# Altium schematic sheet RR-Sheet.SchDoc
size 420 x 297 mm; SheetNumber: 1; SheetTotal: 1
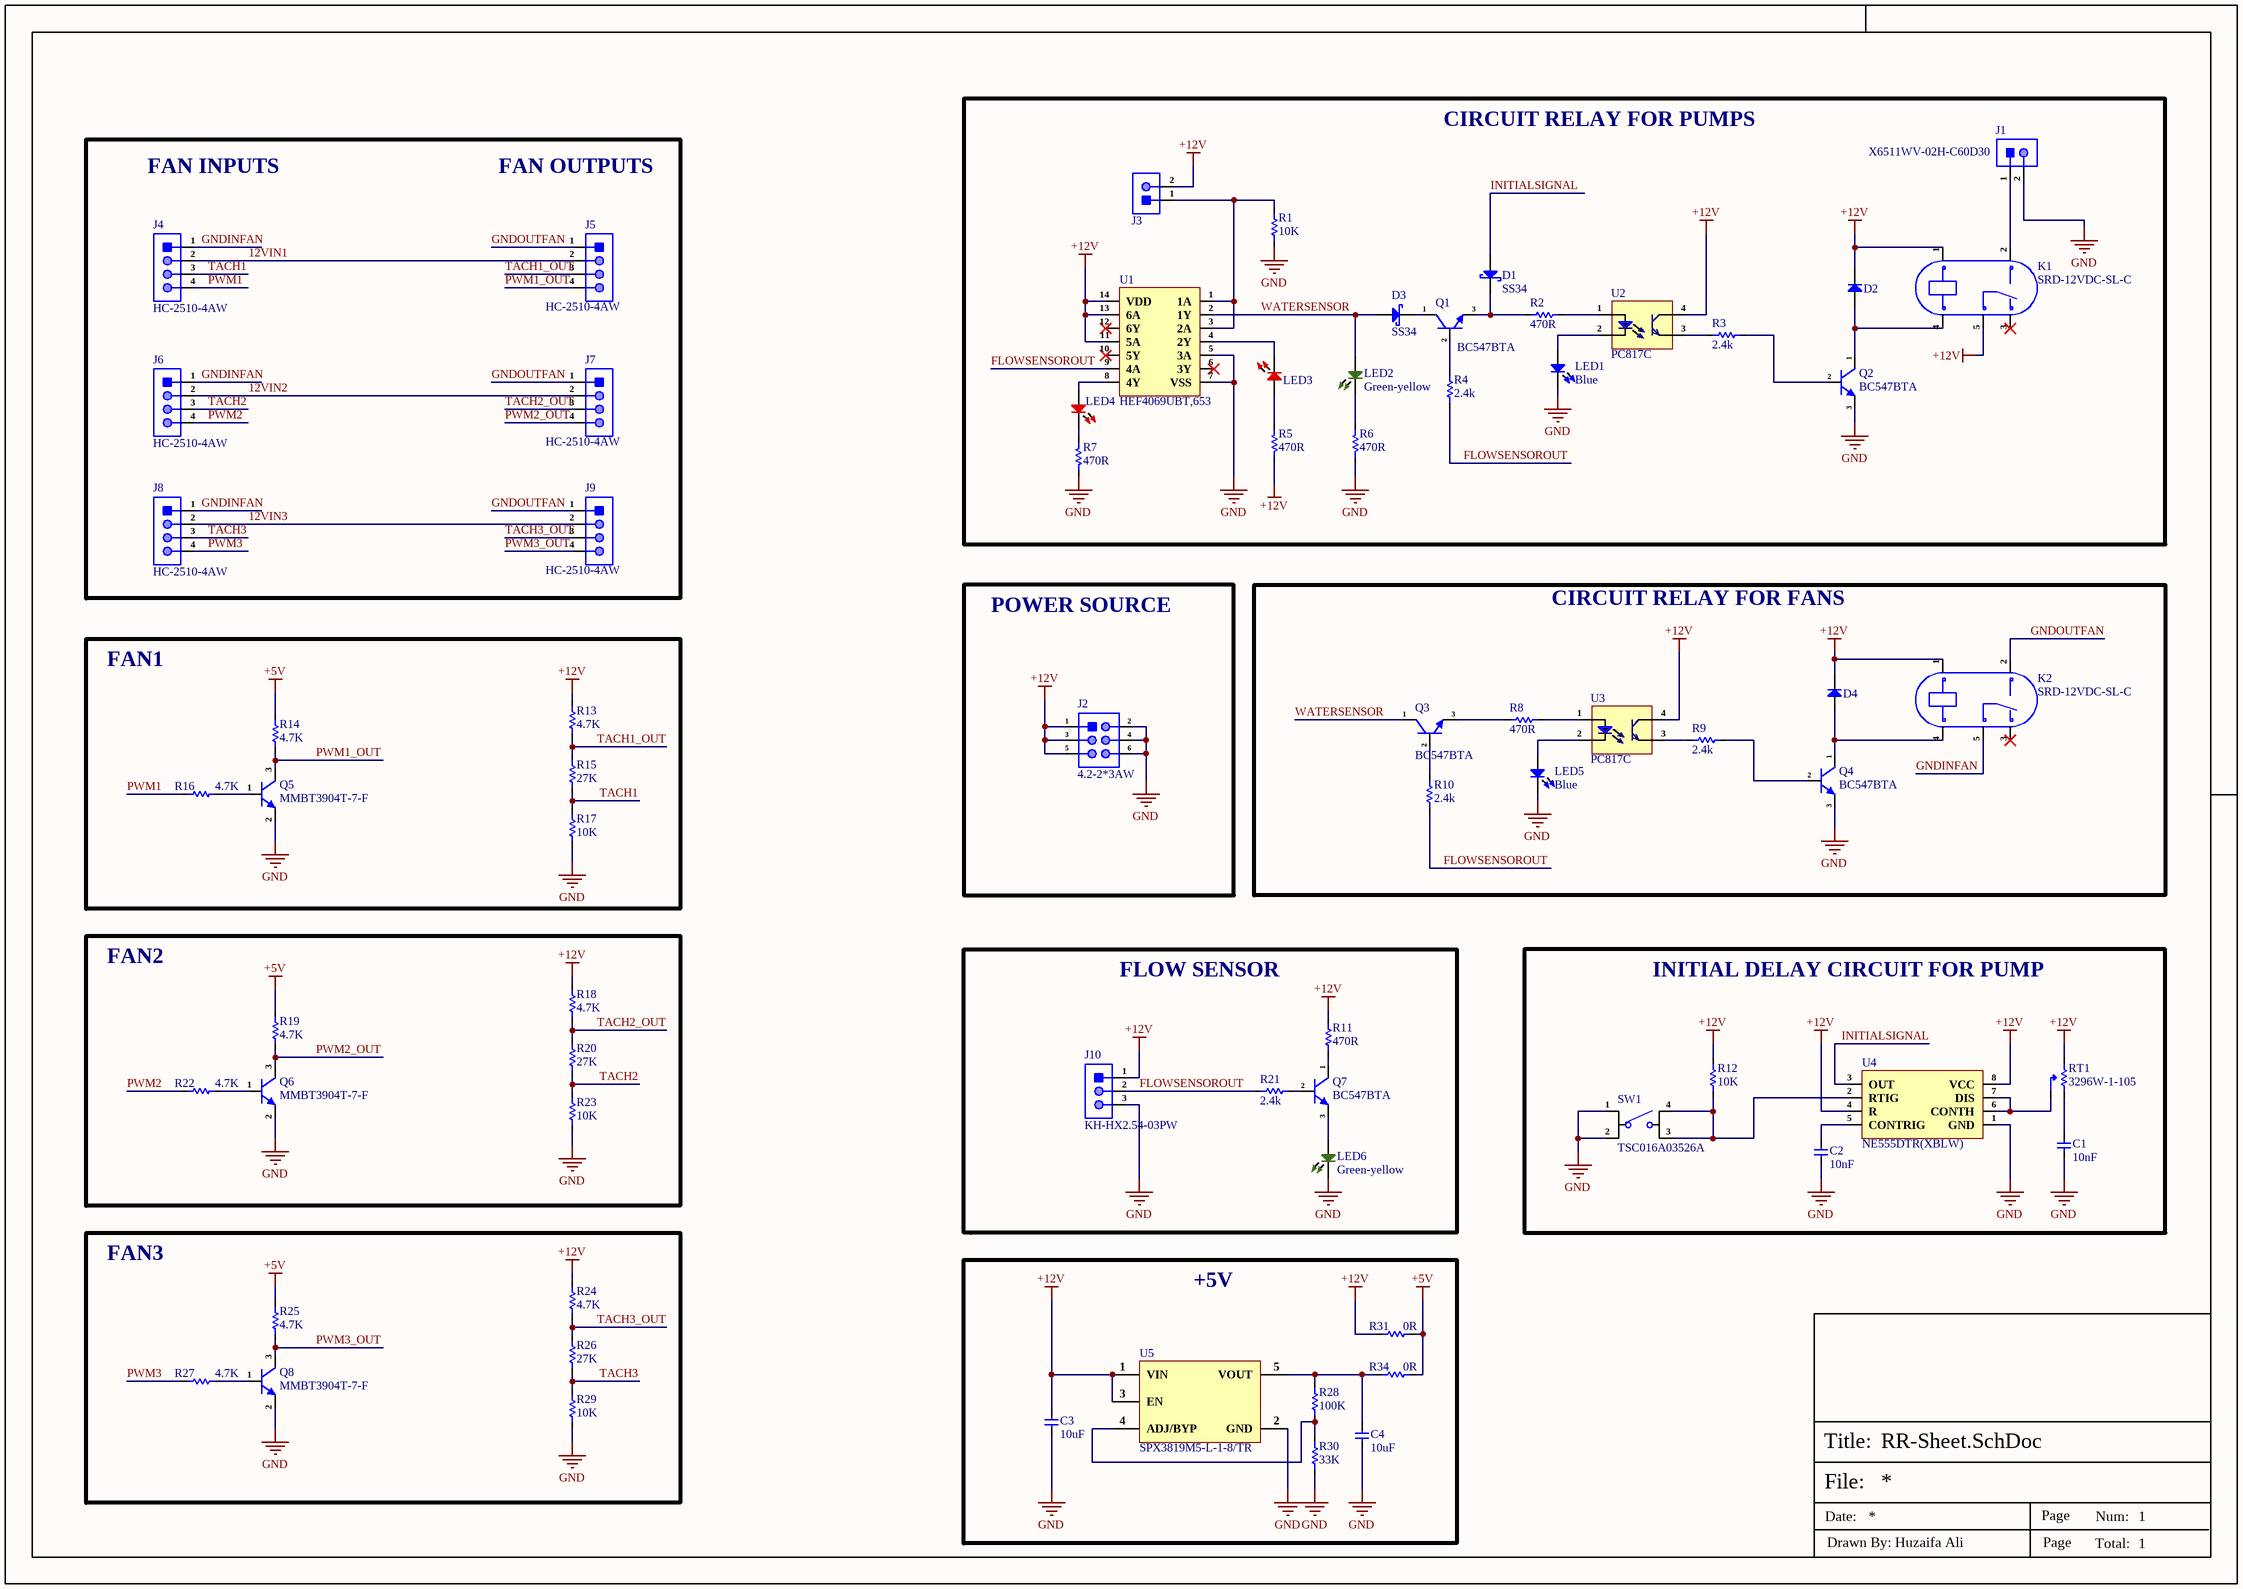
[diagram p0: RR-Sheet.SchDoc]

## Parts
C1  10nF  [Cap-0402]
C2  10nF  [Cap-0402]
C3  10uF  [Cap-0402]
C4  10uF  [Cap-0402]
D1  SS34  [SMA]
D2  SM4007PL A7 46MIL  [SOD-123FL]  (value not drawn)
D3  SS34  [SMA]
D4  SM4007PL A7 46MIL  [SOD-123FL]  (value not drawn)
J1  X6511WV-02H-C60D30  [HDR1X2_]
J2  4.2-2*3AW  [4.2-2*3AW]
J3  B2B-XH-A(LF)(SN)  [B2B-XH-A(LF)(SN)_]  (value not drawn)
J4  HC-2510-4AW  [HC-2510-4AW]
J5  HC-2510-4AW  [HC-2510-4AW]
J6  HC-2510-4AW  [HC-2510-4AW]
J7  HC-2510-4AW  [HC-2510-4AW]
J8  HC-2510-4AW  [HC-2510-4AW]
J9  HC-2510-4AW  [HC-2510-4AW]
J10  KH-HX2.54-03PW  [KH-HX2.54-03PW]
K1  SRD-12VDC-SL-C  [SRD-12VDC-SL-C]
K2  SRD-12VDC-SL-C  [SRD-12VDC-SL-C]
LED1  Blue  [LED-0603]
LED2  Green-yellow  [TH LED Green 3MM]
LED3  204-10SURD/S530-A3-L  [TH LED Red 3MM]  (value not drawn)
LED4  204-10SURD/S530-A3-L  [TH LED Red 3MM]  (value not drawn)
LED5  Blue  [LED-0603]
LED6  Green-yellow  [TH LED Green 3MM]
Q1  BC547BTA  [TO-92-3L]
Q2  BC547BTA  [TO-92-3L]
Q3  BC547BTA  [TO-92-3L]
Q4  BC547BTA  [TO-92-3L]
Q5  MMBT3904T-7-F  [SOT-523]
Q6  MMBT3904T-7-F  [SOT-523]
Q7  BC547BTA  [TO-92-3L]
Q8  MMBT3904T-7-F  [SOT-523]
R1  10K  [Res-0402]
R2  470R  [Res-0402]
R3  2.4k  [Res-0402]
R4  2.4k  [Res-0402]
R5  470R  [Res-0402]
R6  470R  [Res-0402]
R7  470R  [Res-0402]
R8  470R  [Res-0402]
R9  2.4k  [Res-0402]
R10  2.4k  [Res-0402]
R11  470R  [Res-0402]
R12  10K  [Res-0402]
R13  4.7K  [Res-0402]
R14  4.7K  [Res-0402]
R15  27K  [Res-0402]
R16  4.7K  [Res-0402]
R17  10K  [Res-0402]
R18  4.7K  [Res-0402]
R19  4.7K  [Res-0402]
R20  27K  [Res-0402]
R21  2.4k  [Res-0402]
R22  4.7K  [Res-0402]
R23  10K  [Res-0402]
R24  4.7K  [Res-0402]
R25  4.7K  [Res-0402]
R26  27K  [Res-0402]
R27  4.7K  [Res-0402]
R28  100K  [Res-0402]
R29  10K  [Res-0402]
R30  33K  [Res-0402]
R31  0R  [Res-0402]  (no BOM)
R34  0R  [Res-0402]
RT1  3296W-1-105  [3296W-1-105]
SW1  TSC016A03526A  [TSC016A03526A]
U1  HEF4069UBT,653  [SOIC-14]
U2  PC817C  [PC817C]
U3  PC817C  [PC817C]
U4  NE555DTR(XBLW)  [SOP-8]
U5  SPX3819M5-L-1-8/TR  [SOT-23-5]

## Blocks framed on the sheet
CIRCUIT RELAY FOR PUMPS: D1-D3 J1 J3 K1 LED1-LED4 Q1 Q2 R1-R7 U1 U2
FAN1: Q5 R13-R17
POWER SOURCE: J2
CIRCUIT RELAY FOR FANS: D4 K2 LED5 Q3 Q4 R8-R10 U3
FAN2: Q6 R18-R20 R22 R23
FLOW SENSOR: J10 LED6 Q7 R11 R21
INITIAL DELAY CIRCUIT FOR PUMP: C1 C2 R12 RT1 SW1 U4
FAN3: Q8 R24-R27 R29
+5V: C3 C4 R28 R30 R31 R34 U5

## Nets
+5V: R14.2 R19.2 R25.2 R31.1 R34.2
+12V: C3.2 D2.1(K) D4.1(K) J2.1 J2.3 J2.5 J3.2 J10.1 K1.1 K1.5 K2.1 R5.1 R11.2 R12.1 R13.2 R18.2 R24.2 R31.2 RT1.3(CW) U1.11(5A) U1.13(6A) U1.14(VDD) U2.4(C) U3.4(C) U4.4(R) U4.8(VCC) U5.1(VIN) U5.3(EN)
GND: C1.1 C2.1 C3.1 C4.1 J1.2 J2.2 J2.4 J2.6 J10.3 LED1.2 LED5.2 LED6.2 Q2.3(E) Q4.3(E) Q5.2(E) Q6.2(E) Q8.2(E) R1.1 R6.1 R7.1 R17.1 R23.1 R29.1 R30.1 SW1.1 SW1.2 U1.5(3A) U1.7(VSS) U4.1(GND) U5.2(GND)
12VIN1: J4.2 J5.2
12VIN2: J6.2 J7.2
12VIN3: J8.2 J9.2
FLOWSENSOROUT: J10.2 R4.1 R10.1 R21.2 U1.9(4A)
GNDINFAN: J4.1 J6.1 J8.1 K2.5
GNDOUTFAN: J5.1 J7.1 J9.1 K2.2
INITIALSIGNAL: D1.2(A) U4.3(OUT)
PWM1: J4.4 R16.1
PWM1_OUT: J5.4 Q5.3(C) R14.1
PWM2: J6.4 R22.1
PWM2_OUT: J7.4 Q6.3(C) R19.1
PWM3: J8.4 R27.1
PWM3_OUT: J9.4 Q8.3(C) R25.1
TACH1: J4.3 R15.1 R17.2
TACH1_OUT: J5.3 R13.1 R15.2
TACH2: J6.3 R20.1 R23.2
TACH2_OUT: J7.3 R18.1 R20.2
TACH3: J8.3 R26.1 R29.2
TACH3_OUT: J9.3 R24.1 R26.2
WATERSENSOR: D3.2(A) LED2.1 Q3.1(C) U1.2(1Y)
NetC1_2: C1.2 RT1.1(CCW)
NetC2_2: C2.2 U4.5(CONTRIG)
NetC4_2: C4.2 R28.2 R34.1 U5.5(VOUT)
NetD1_1: D1.1(K) Q1.3(E) R2.1
NetD2_2: D2.2(A) K1.4 Q2.1(C)
NetD3_1: D3.1(K) Q1.1(C)
NetD4_2: D4.2(A) K2.4 Q4.1(C)
NetJ1_1: J1.1 K1.2
NetJ3_1: J3.1 R1.2 U1.1(1A) U1.3(2A)
NetLED1_1: LED1.1 U2.2(Ca)
NetLED2_2: LED2.2 R6.2
NetLED3_1: LED3.1 R5.2
NetLED3_2: LED3.2 U1.4(2Y)
NetLED4_1: LED4.1 U1.8(4Y)
NetLED4_2: LED4.2 R7.2
NetLED5_1: LED5.1 U3.2(Ca)
NetLED6_1: LED6.1 Q7.3(E)
NetQ1_2: Q1.2(B) R4.2
NetQ2_2: Q2.2(B) R3.2
NetQ3_2: Q3.2(B) R10.2
NetQ3_3: Q3.3(E) R8.1
NetQ4_2: Q4.2(B) R9.2
NetQ5_1: Q5.1(B) R16.2
NetQ6_1: Q6.1(B) R22.2
NetQ7_1: Q7.1(C) R11.1
NetQ7_2: Q7.2(B) R21.1
NetQ8_1: Q8.1(B) R27.2
NetR2_2: R2.2 U2.1(An)
NetR3_1: R3.1 U2.3(E)
NetR8_2: R8.2 U3.1(An)
NetR9_1: R9.1 U3.3(E)
NetR12_2: R12.2 SW1.3 SW1.4 U4.2(RTIG)
NetR28_1: R28.1 R30.2 U5.4(ADJ/BYP)
NetRT1_2: RT1.2(Wiper) U4.6(CONTH) U4.7(DIS)

Not connected (* = marked no-connect by the designer): K1 3*; K2 3*; U1 6(3Y)* 10(5Y)* 12(6Y)*

## Notes on the sheet
- FAN INPUTS
- FAN OUTPUTS
- File:
- Title:
- Date:
- Page
- Num:
- Total:
- Drawn By: Huzaifa Ali

## Library data of the parts
C1 C2 = CC0402KRX7R9BB103: CAP CER 10000PF 50V X7R 0402; Manufacturer: Yageo; Tolerance: 10%; Item Type: Capacitor; Supplier 1: Avnet; Manufacturer Part Number: CC0402KRX7R9BB103; RoHS: Yes; Category: Ceramic Capacitors; Stock 1: 995000; Pricing 1: 10000=0.00178 (USD); Mount: Surface Mount; Case/Package: 0402; Case Code (Imperial): 0402; Case Code (Metric): 1005; Min Operating Temperature: -55°C; Max Operating Temperature: 125°C; Capacitance: 10nF; Dielectric: X7R; Packaging: Tape and Reel; Voltage Rating: 50V; Voltage Rating (DC): 50V; Package Quantity: 1; Termination: SMD/SMT; Resistor Type: Ceramic; Voltage: 50V; Series: CC; Length: 1mm; Width: 0.02inch; Height: 0.5mm; Thickness: 0.022inch; Depth: 0.5mm; Radiation Hardening: No; RoHS Compliant: Yes; Reach SVHC Compliant: Yes; Lead Free: Lead Free; Halogen Free: Halogen Free; ComponentLink1URL: https://datasheet.ciiva.com/11788/0900766b8079c870-11788375.pdf?src-supplier=RSComponents; ComponentLink1Description: https://datasheet.ciiva.com/11788/0900766b8079c870-11788375.pdf?src-supplier=RSComponents; ComponentLink2URL: https://datasheet.ciiva.com/26862/getdatasheetpartid-138248-26862642.pdf?src-supplier=Verical; ComponentLink2Description: https://datasheet.ciiva.com/26862/getdatasheetpartid-138248-26862642.pdf?src-supplier=Verical; ComponentLink3URL: https://datasheet.ciiva.com/7978/1489800-7978093.pdf?src-supplier=Element14; ComponentLink3Description: https://datasheet.ciiva.com/7978/1489800-7978093.pdf?src-supplier=Element14; ComponentLink4URL: https://datasheet.ciiva.com/28450/1489800-28450377.pdf?src-supplier=Element14; ComponentLink4Description: https://datasheet.ciiva.com/28450/1489800-28450377.pdf?src-supplier=Element14; ComponentLink5URL: https://datasheet.ciiva.com/176/mlccorderingcode-176349.pdf?src-supplier=Digi-Key; ComponentLink5Description: https://datasheet.ciiva.com/176/mlccorderingcode-176349.pdf?src-supplier=Digi-Key; ComponentLink6URL: https://datasheet.ciiva.com/176/mlccorderingcode-176348.pdf?src-supplier=Digi-Key; ComponentLink6Description: https://datasheet.ciiva.com/176/mlccorderingcode-176348.pdf?src-supplier=Digi-Key; ComponentLink7URL: https://datasheet.ciiva.com/176/mlccorderingcode-176350.pdf?src-supplier=Digi-Key; ComponentLink7Description: https://datasheet.ciiva.com/176/mlccorderingcode-176350.pdf?src-supplier=Digi-Key; Supplier Part Number 1: CC0402KRX7R9BB103; LCSC Part Number: C60133
C3 C4 = CL05A106MP5NUNC: CAP CER 10UF 10V X5R 0402; Manufacturer: Samsung; Tolerance: 20%; Item Type: Capacitor; Supplier 1: Avnet; Manufacturer Part Number: CL05A106MP5NUNC; RoHS: Yes; Category: Ceramic Capacitors; Stock 1: 1729850; Pricing 1: 10000=0.02537 (USD); Mount: Surface Mount; Case/Package: 0402; Case Code (Metric): 1005; Case Code (Imperial): 0402; Contact Plating: Tin; Min Operating Temperature: -55°C; Max Operating Temperature: 85°C; Package Quantity: 1; Packaging: Tape and Reel; Capacitance: 10uF; Voltage Rating: 10V; Dielectric: X5R; Termination: Wraparound; Series: CL; Construction: Flat; Length: 1mm; Width: 0.02inch; Thickness: 0.028inch; Depth: 0.5mm; Radiation Hardening: No; Lead Free: Lead Free; RoHS Compliant: Yes; ComponentLink1URL: https://datasheet.ciiva.com/25721/cl05a106mp5nunc-25721584.pdf?src-supplier=Digi-Key; ComponentLink1Description: https://datasheet.ciiva.com/25721/cl05a106mp5nunc-25721584.pdf?src-supplier=Digi-Key; ComponentLink2URL: https://datasheet.ciiva.com/26838/getdatasheetpartid-745310-26838170.pdf?src-supplier=Verical; ComponentLink2Description: https://datasheet.ciiva.com/26838/getdatasheetpartid-745310-26838170.pdf?src-supplier=Verical; Supplier Part Number 1: CL05A106MP5NUNC; LCSC Part Number: C315248
D1 D3 = SS34: 0.5mA@40V 40V Single 3A 0.55V@3A SMA(DO-214AC) Schottky Barrier Diodes (SBD) ROHS; Manufacturer: MDD; Item Type: Diode; Manufacturer Part Number: SS34; Package: SMA(DO-214AC); LCSC Part Number: C8678; ComponentLink1Description: LCSC; ComponentLink1URL: https://www.lcsc.com/product-detail/Schottky-Barrier-Diodes-SBD_MDD-Microdiode-Electronics-SS34_C8678.html
D2 D4 = SM4007PL A7 46MIL: 900mA 1.1V@1A 1kV SOD-123FL Diodes - General Purpose ROHS; Manufacturer: YONGYUTAI; Item Type: Diode; Manufacturer Part Number: SM4007PL A7 46MIL; Package: SOD-123FL; LCSC Part Number: C2916249; ComponentLink1Description: LCSC; ComponentLink1URL: https://www.lcsc.com/product-detail/Diodes-General-Purpose_YONGYUTAI-SM4007PL-A7-46MIL_C2916249.html
J1 = X6511WV-02H-C60D30: Gold 250V 3A Straight Square Pins 2.5mm 2P 260℃ 6mm -40℃~+105℃ 3mm 2.54mm Plugin Black Brass 1x2P Plugin,P=2.54mm Pin Headers ROHS; Manufacturer: XKB; Item Type: Male Header; Manufacturer Part Number: X6511WV-02H-C60D30; Package: Plugin,P=2.54mm; LCSC Part Number: C706874; ComponentLink1Description: LCSC; ComponentLink1URL: https://www.lcsc.com/product-detail/Pin-Headers_XKB-Connectivity-X6511WV-02H-C60D30_C706874.html
J2 = 4.2-2*3AW: 4.2mm Wire To Board Connector ROHS; Manufacturer: BOOMELE; Manufacturer Part Number: 4.2-2*3AW; Package: Custom; LCSC Part Number: C35447; Item Type: Wire To Board Connector; ComponentLink1Description: LCSC; ComponentLink1URL: https://jlcpcb.com/partdetail/boomele_boom_Precision_elec-4_2_23AW/C35447
J3 = B2B-XH-A(LF)(SN): Conn Shrouded Header (4 Sides) HDR 2 POS 2.5mm Solder ST Thru-Hole Box; Manufacturer: JST; Number of Positions: 2; Connector Type: Male Pin; Current Rating: 3A; Contact Resistance: 20mR; Voltage Rating: 250V; Insulation Resistance: 1GR; Wire/Cable Gauge: 22AWG; Item Type: JST Connector; Supplier 1: Farnell; Manufacturer Part Number: B2B-XH-A(LF)(SN); RoHS: Yes; Category: FFC / FPC; Stock 1: 219240; Pricing 1: 100=0.06860, 1000=0.04800, 2500=0.04520, 5000=0.04230, 10000=0.03950, 20000=0.03660 (GBP); Mount: Through Hole; Contact Plating: Tin,Copper,Lead; Color: Natural; Contact Material: Brass; Housing Color: White; Housing Material: Polyamide; Min Operating Temperature: -25°C; Max Operating Temperature: 85°C; Number of Rows: 1; Packaging: Bulk; Termination: Solder; Fastening Type: Detent; Max Current Rating: 3A; Voltage Rating (AC): 250V; Max Voltage Rating (AC): 250V; Number of Contacts: 2; Max Voltage Rating (DC): 250V; Orientation: Straight; Length: 7.4mm; Pitch: 2.5mm; Lead Pitch: 2.5mm; Depth: 5.75mm; REACH SVHC: No SVHC; Lead Free: Lead Free; ComponentLink1URL: https://datasheet.ciiva.com/26894/getdatasheetpartid-640357-26894434.pdf?src-supplier=Verical; ComponentLink1Description: https://datasheet.ciiva.com/26894/getdatasheetpartid-640357-26894434.pdf?src-supplier=Verical; ComponentLink2URL: https://datasheet.ciiva.com/11746/0900766b8082653e-11746979.pdf?src-supplier=RSComponents; ComponentLink2Description: https://datasheet.ciiva.com/11746/0900766b8082653e-11746979.pdf?src-supplier=RSComponents; ComponentLink3URL: https://datasheet.ciiva.com/26894/getdatasheetpartid-385291-26894760.pdf?src-supplier=Verical; ComponentLink3Description: https://datasheet.ciiva.com/26894/getdatasheetpartid-385291-26894760.pdf?src-supplier=Verical; ComponentLink4URL: https://datasheet.ciiva.com/8052/5448-8052024.pdf?src-supplier=Element14; ComponentLink4Description: https://datasheet.ciiva.com/8052/5448-8052024.pdf?src-supplier=Element14; ComponentLink5URL: https://datasheet.ciiva.com/20207/523653-20207167.pdf?src-supplier=Rapid+Electronics; ComponentLink5Description: https://datasheet.ciiva.com/20207/523653-20207167.pdf?src-supplier=Rapid+Electronics; Supplier Part Number 1: 1516276; LCSC Part Number: C158012
J4-J9 = HC-2510-4AW: 1x4P 4P 1 Tin 2.54mm 4 -25℃~+85℃ Brass 4A Right-Angle Push-Pull,P=2.54mm Wire To Board Connector ROHS; Manufacturer: HCTL; Manufacturer Part Number: HC-2510-4AW; Package: Push-Pull,P=2.54mm; LCSC Part Number: C2982043; Item Type: Wire To Board Connector; ComponentLink1Description: LCSC; ComponentLink1URL: https://www.lcsc.com/product-detail/Wire-To-Board-Connector_HCTL-HC-2510-4AW_C2982043.html
J10 = KH-HX2.54-03PW: 1x3P 3P 1 2.54mm 3 Right-Angle Push-Pull,P=2.54mm Wire To Board Connector ROHS; Manufacturer: Shenzhen Kinghelm Elec; Manufacturer Part Number: KH-HX2.54-03PW; Package: Push-Pull,P=2.54mm; LCSC Part Number: C3250035; Item Type: Wire To Board Connector; ComponentLink1Description: LCSC; ComponentLink1URL: https://www.lcsc.com/product-detail/Wire-To-Board-Connector_Shenzhen-Kinghelm-Elec-KH-HX2-54-03PW_C3250035.html
K1 K2 = SRD-12VDC-SL-C: 250V@AC 12V 15A SPDT (1 Form C) Plugin,15.6x19.2mm Power Relays ROHS; Manufacturer: Ningbo Forward Relay; Supplier: LCSC; LCSC Part Number: C30431; Manufacturer Part Number: SRD-12VDC-SL-C; RoHS: No; Category: Uncategorized
LED1 LED5 = NCD0603B3: blue 0603 Light Emitting Diodes (LED) ROHS; Manufacturer: Foshan NationStar Optoelectronics; Manufacturer Part Number: NCD0603B3; Package: 0603; LCSC Part Number: C158101; Item Type: LED; ComponentLink1Description: LCSC; ComponentLink1URL: https://www.lcsc.com/product-detail/Light-Emitting-Diodes-LED_Foshan-NationStar-Optoelectronics-NCD0603B3_C158101.html
LED2 LED6 = 204-10SYGD/S530-E3: LED Single Standard Yellow Green 573nm 25mA 2-Pin T-1 Bag; Manufacturer: Everlight; Viewing Angle: 45°; Luminous Intensity: 100mcd; Forward Voltage: 2.4V; Lens Style: Diffused,Colored; Power Dissipation: 60W; Number of Elements: 1; Reverse Voltage: 5V; Supplier: Digikey; Supplier Part Number: 1080-204-10SYGD/S530-E3TR-ND; Manufacturer Part Number: 204-10SYGD/S530-E3; RoHS: Yes; Pricing: 3000=0.10482, 5000=0.09847, 10000=0.09212, 25000=0.08449, 50000=0.08132, 100000=0.07941 (USD); Mounting Technology: Through Hole; Case/Package: T; Pins: 2; Min Operating Temperature: -40°C; Max Operating Temperature: 85°C; Forward Current: 25mA; Packaging: Tape and Reel; Dominant Wavelength: 573nm; Wavelength: 573nm; Length: 4mm; Depth: 4mm; Radiation Hardening: No; RoHS Compliant: Yes; ComponentLink1URL: https://datasheet.ciiva.com/26901/getdatasheetpartid-707371-26901329.pdf?src-supplier=Verical; ComponentLink1Description: https://datasheet.ciiva.com/26901/getdatasheetpartid-707371-26901329.pdf?src-supplier=Verical; LCSC Part Number: C85161; Item Type: LED
LED3 LED4 = 204-10SURD/S530-A3-L: 20mA 624nm -40℃~+85℃ Red 40° 3mm圆形灯头 60mW Plugin,D=3mm Light Emitting Diodes (LED) ROHS; Manufacturer: Everlight Elec; Manufacturer Part Number: 204-10SURD/S530-A3-L; Package: Plugin,D=3mm; LCSC Part Number: C99771; Item Type: LED; ComponentLink1Description: LCSC; ComponentLink1URL: https://www.lcsc.com/product-detail/Light-Emitting-Diodes-LED_Everlight-Elec-204-10SURD-S530-A3-L_C99771.html
Q1-Q4 Q7 = BC547BTA: TRANS NPN 45V 0.1A TO92-3; Manufacturer: ON Semiconductor / Fairchild; Item Type: BJTs; Supplier: Future Electronics; Supplier Part Number: 4008015; Manufacturer Part Number: BC547BTA; RoHS: Yes; Stock: 10000; Pricing: 2000=0.041, 8000=0.0391, 20000=0.0379, 50000=0.0368, 80000=0.0351 (USD); Lead Free: 5697LeadFree; ComponentLink1URL: https://datasheet.ciiva.com/5770/bc546-5770589.pdf?src-supplier=Farnell; ComponentLink1Description: https://datasheet.ciiva.com/5770/bc546-5770589.pdf?src-supplier=Farnell; ComponentLink2URL: https://datasheet.ciiva.com/971/bc546-971924.pdf?src-supplier=Digikey; ComponentLink2Description: https://datasheet.ciiva.com/971/bc546-971924.pdf?src-supplier=Digikey; ComponentLink3URL: https://datasheet.ciiva.com/971/bc546-971925.pdf?src-supplier=Digikey; ComponentLink3Description: https://datasheet.ciiva.com/971/bc546-971925.pdf?src-supplier=Digikey; ComponentLink4URL: https://datasheet.ciiva.com/11197/bc550-11197771.pdf?src-supplier=Avnet; ComponentLink4Description: https://datasheet.ciiva.com/11197/bc550-11197771.pdf?src-supplier=Avnet; ComponentLink5URL: https://datasheet.ciiva.com/4722/bc547-4722169.pdf?src-supplier=Mouser; ComponentLink5Description: https://datasheet.ciiva.com/4722/bc547-4722169.pdf?src-supplier=Mouser; ComponentLink6URL: https://datasheet.ciiva.com/1195/1868820-1195467.pdf?src-supplier=Element14; ComponentLink6Description: https://datasheet.ciiva.com/1195/1868820-1195467.pdf?src-supplier=Element14; ComponentLink7URL: https://datasheet.ciiva.com/1195/1868820-1195468.pdf?src-supplier=Element14; ComponentLink7Description: https://datasheet.ciiva.com/1195/1868820-1195468.pdf?src-supplier=Element14; ComponentLink8URL: https://datasheet.ciiva.com/17179/bc546-17179703.pdf?src-supplier=Future+Electronics; ComponentLink8Description: https://datasheet.ciiva.com/17179/bc546-17179703.pdf?src-supplier=Future+Electronics; LCSC Part Number: C258144
Q5 Q6 Q8 = MMBT3904T-7-F: TRANS NPN 40V 0.2A SOT523; Manufacturer: Diodes Zetex; Item Type: Transistor; Supplier: Future Electronics; Supplier Part Number: 4140292; Manufacturer Part Number: MMBT3904T-7-F; RoHS: Yes; Category: BJTs; Stock: 36000; Pricing: 3000=0.0261, 9000=0.0252, 15000=0.0248, 60000=0.0236, 90000=0.0229 (USD); ComponentLink1URL: https://datasheet.ciiva.com/15139/getdatasheetpartid-142850-15139485.pdf?src-supplier=Verical; ComponentLink1Description: https://datasheet.ciiva.com/15139/getdatasheetpartid-142850-15139485.pdf?src-supplier=Verical; ComponentLink2URL: https://datasheet.ciiva.com/11199/ds30270-11199009.pdf?src-supplier=Avnet; ComponentLink2Description: https://datasheet.ciiva.com/11199/ds30270-11199009.pdf?src-supplier=Avnet; ComponentLink3URL: https://datasheet.ciiva.com/17053/0900766b80e49818-17053736.pdf?src-supplier=Allied+Electronics; ComponentLink3Description: https://datasheet.ciiva.com/17053/0900766b80e49818-17053736.pdf?src-supplier=Allied+Electronics; ComponentLink4URL: https://datasheet.ciiva.com/8029/ds30270-8029717.pdf?src-supplier=Element14; ComponentLink4Description: https://datasheet.ciiva.com/8029/ds30270-8029717.pdf?src-supplier=Element14; ComponentLink5URL: https://datasheet.ciiva.com/22711/480146-22711751.pdf?src-supplier=Element14; ComponentLink5Description: https://datasheet.ciiva.com/22711/480146-22711751.pdf?src-supplier=Element14; ComponentLink6URL: https://datasheet.ciiva.com/4723/ds30270-4723401.pdf?src-supplier=Mouser; ComponentLink6Description: https://datasheet.ciiva.com/4723/ds30270-4723401.pdf?src-supplier=Mouser; ComponentLink7URL: https://datasheet.ciiva.com/6360/ds30270-6360919.pdf?src-supplier=Digikey; ComponentLink7Description: https://datasheet.ciiva.com/6360/ds30270-6360919.pdf?src-supplier=Digikey; LCSC Part Number: C239187
R1 R12 R17 R23 R29 = RC0402FR-0710KL: RES 10K OHM 1% 1/16W 0402; Manufacturer: Yageo; Resistance: 10kR; Voltage Rating (DC): 50V; Temperature Coefficient: 100ppm/°C; Power Rating: 62.5mW; Max Power Dissipation: 63mW; Item Type: Resistor; Supplier 1: Mouser; Manufacturer Part Number: RC0402FR-0710KL; RoHS: Yes; Category: Chip SMD Resistors; Stock 1: 18648329; Pricing 1: 1=0.10000, 10=0.01400, 50=0.01400, 100=0.00500, 1000=0.00300, 10000=0.00200 (USD); Case/Package: 0402; Number of Pins: 2; Case Code (Imperial): 0402; Case Code (Metric): 1005; Min Operating Temperature: -55°C; Max Operating Temperature: 155°C; Resistor Type: Thick Film; Tolerance: 1%; Packaging: Tape and Reel; Voltage Rating: 50V; Termination: SMD/SMT; Working Voltage: 50V; Number of Terminations: 2; Features: Moisture Resistant; Series: RC; Resistance Tolerance: 1%; Construction: Rectangular; Length: 1mm; Width: 0.5mm; Height: 0.32mm; Depth: 0.5mm; Lead Pitch: 0.2mm; REACH SVHC: No SVHC; Lead Free: Lead Free; RoHS Compliant: Yes; Military Standard: Not; ComponentLink1URL: https://datasheet.ciiva.com/7660/38568-7660787.pdf?src-supplier=Element14; ComponentLink1Description: https://datasheet.ciiva.com/7660/38568-7660787.pdf?src-supplier=Element14; ComponentLink2URL: https://datasheet.ciiva.com/7849/1686128-7849814.pdf?src-supplier=Element14; ComponentLink2Description: https://datasheet.ciiva.com/7849/1686128-7849814.pdf?src-supplier=Element14; ComponentLink3URL: https://datasheet.ciiva.com/7983/1018594-7983486.pdf?src-supplier=Element14; ComponentLink3Description: https://datasheet.ciiva.com/7983/1018594-7983486.pdf?src-supplier=Element14; ComponentLink4URL: https://datasheet.ciiva.com/22747/1018594-22747512.pdf?src-supplier=Element14; ComponentLink4Description: https://datasheet.ciiva.com/22747/1018594-22747512.pdf?src-supplier=Element14; ComponentLink5URL: https://datasheet.ciiva.com/12667/pyu-rc0402-51-rohs-l-6-r-12667067.pdf?src-supplier=Mouser; ComponentLink5Description: https://datasheet.ciiva.com/12667/pyu-rc0402-51-rohs-l-6-r-12667067.pdf?src-supplier=Mouser; ComponentLink6URL: https://datasheet.ciiva.com/7849/1784430-7849813.pdf?src-supplier=Element14; ComponentLink6Description: https://datasheet.ciiva.com/7849/1784430-7849813.pdf?src-supplier=Element14; ComponentLink7URL: https://datasheet.ciiva.com/7849/1784430-7849815.pdf?src-supplier=Element14; ComponentLink7Description: https://datasheet.ciiva.com/7849/1784430-7849815.pdf?src-supplier=Element14; Supplier Part Number 1: 603-RC0402FR-0710KL; LCSC Part Number: C60490
R2 R5-R8 R11 = RC0402FR-07470RL: RES 470 OHM 1% 1/16W 0402; Manufacturer: Yageo; Item Type: Resistor; Voltage Rating: 50V; Power Rating: 62.5mW; Temperature Coefficient: 100ppm/°C; Max Power Dissipation: 63mW; Supplier: Avnet; Supplier Part Number: RC0402FR-07470RL; Manufacturer Part Number: RC0402FR-07470RL; RoHS: Yes; Stock: 10000; Pricing: 10000=0.00085 (USD); Case/Package: 0402; Case Code (Metric): 1005; Case Code (Imperial): 0402; Min Operating Temperature: -55°C; Max Operating Temperature: 155°C; Packaging: Tape and Reel; Value: 470R; Tolerance: 1%; Number of Terminations: 2; Working Voltage: 50V; Package Quantity: 1; Resistor Type: Thick Film; Termination: SMD/SMT; Features: Moisture Resistant; Series: RC; Resistance Tolerance: 1%; Construction: Rectangular; Voltage Rating (AC): 50V; Length: 1mm; Width: 0.02inch; Height: 0.016inch; Depth: 0.5mm; Lead Free: Lead Free; Reach SVHC Compliant: No; RoHS Compliant: Yes; Military Standard: Not; ComponentLink1URL: https://datasheet.ciiva.com/46412/1018594-46412838.pdf?src-supplier=Element14; ComponentLink1Description: https://datasheet.ciiva.com/46412/1018594-46412838.pdf?src-supplier=Element14; ComponentLink2URL: https://datasheet.ciiva.com/2453/pyu-r-int-thick-7-2453377.pdf?src-supplier=Digikey; ComponentLink2Description: https://datasheet.ciiva.com/2453/pyu-r-int-thick-7-2453377.pdf?src-supplier=Digikey; ComponentLink3URL: https://datasheet.ciiva.com/2453/pyu-r-int-thick-7-2453378.pdf?src-supplier=Digikey; ComponentLink3Description: https://datasheet.ciiva.com/2453/pyu-r-int-thick-7-2453378.pdf?src-supplier=Digikey; ComponentLink4URL: https://datasheet.ciiva.com/2453/pyu-r-int-thick-7-2453376.pdf?src-supplier=Digikey; ComponentLink4Description: https://datasheet.ciiva.com/2453/pyu-r-int-thick-7-2453376.pdf?src-supplier=Digikey; ComponentLink5URL: https://datasheet.ciiva.com/7850/1018594-7850015.pdf?src-supplier=Element14; ComponentLink5Description: https://datasheet.ciiva.com/7850/1018594-7850015.pdf?src-supplier=Element14; ComponentLink6URL: https://datasheet.ciiva.com/7850/1018594-7850014.pdf?src-supplier=Element14; ComponentLink6Description: https://datasheet.ciiva.com/7850/1018594-7850014.pdf?src-supplier=Element14; ComponentLink7URL: https://datasheet.ciiva.com/15189/getdatasheetpartid-330246-15189463.pdf?src-supplier=Verical; ComponentLink7Description: https://datasheet.ciiva.com/15189/getdatasheetpartid-330246-15189463.pdf?src-supplier=Verical; LCSC Part Number: C114877
R3 R4 R9 R10 R21 = RC0402FR-072K4L: RES 2.4K OHM 1% 1/16W 0402; Manufacturer: Yageo; Value: 2.4kR; Power Rating: 63mW; Voltage Rating: 50V; Temperature Coefficient: 100ppm/°C; Item Type: Resistor; Supplier 1: Future Electronics; Manufacturer Part Number: RC0402FR-072K4L; RoHS: Yes; Category: Chip SMD Resistors; Stock 1: 20000; Pricing 1: 10000=0.001, 50000=0.001, 200000=0.0009, 300000=0.0009, 750000=0.0009, 1000000=0.0009, 2000000=0.0009, 3000000=0.0008, 7500000=0.0008 (USD); Case/Package: 0402; Case Code (Metric): 1005; Case Code (Imperial): 0402; Min Operating Temperature: -55°C; Max Operating Temperature: 155°C; Packaging: Tape and Reel; Tolerance: 1%; Package Quantity: 1; Resistor Type: Thick Film; Number of Terminations: 2; Termination: SMD/SMT; Max Power Dissipation: 63mW; Voltage Rating (DC): 50V; Features: Moisture Resistant; Series: RC; Construction: Rectangular; Resistance Tolerance: 1%; Length: 0.039inch; Width: 0.02inch; Height: 0.016inch; Depth: 0.5mm; Military Standard: Not; Lead Free: Lead Free; RoHS Compliant: Yes; Reach SVHC Compliant: Unknown; ComponentLink1URL: https://datasheet.ciiva.com/7849/1018594-7849930.pdf?src-supplier=Element14; ComponentLink1Description: https://datasheet.ciiva.com/7849/1018594-7849930.pdf?src-supplier=Element14; ComponentLink2URL: https://datasheet.ciiva.com/7849/1018594-7849931.pdf?src-supplier=Element14; ComponentLink2Description: https://datasheet.ciiva.com/7849/1018594-7849931.pdf?src-supplier=Element14; ComponentLink3URL: https://datasheet.ciiva.com/2453/pyu-r-int-thick-7-2453428.pdf?src-supplier=Digi-Key; ComponentLink3Description: https://datasheet.ciiva.com/2453/pyu-r-int-thick-7-2453428.pdf?src-supplier=Digi-Key; ComponentLink4URL: https://datasheet.ciiva.com/2453/pyu-r-int-thick-7-2453429.pdf?src-supplier=Digi-Key; ComponentLink4Description: https://datasheet.ciiva.com/2453/pyu-r-int-thick-7-2453429.pdf?src-supplier=Digi-Key; ComponentLink5URL: https://datasheet.ciiva.com/2453/pyu-r-int-thick-7-2453427.pdf?src-supplier=Digi-Key; ComponentLink5Description: https://datasheet.ciiva.com/2453/pyu-r-int-thick-7-2453427.pdf?src-supplier=Digi-Key; ComponentLink6URL: https://datasheet.ciiva.com/12667/pyu-rc0402-51-rohs-l-6-r-12667437.pdf?src-supplier=Mouser; ComponentLink6Description: https://datasheet.ciiva.com/12667/pyu-rc0402-51-rohs-l-6-r-12667437.pdf?src-supplier=Mouser; ComponentLink7URL: https://datasheet.ciiva.com/17423/pyu-rc0402-51-rohs-l-6-r-17423915.pdf?src-supplier=Future+Electronics; ComponentLink7Description: https://datasheet.ciiva.com/17423/pyu-rc0402-51-rohs-l-6-r-17423915.pdf?src-supplier=Future+Electronics; Supplier Part Number 1: 3635539; LCSC Part Number: C112296
R13 R14 R16 R18 R19 R22 R24 R25 R27 = RC0402FR-074K7L: RES 4.7K OHM 1% 1/16W 0402; Manufacturer: Yageo; Voltage Rating (DC): 50V; Power Rating: 62.5mW; Resistance: 4.7kR; Temperature Coefficient: 100ppm/°C; Max Power Dissipation: 63mW; Item Type: Resistor; Supplier 1: Avnet; Manufacturer Part Number: RC0402FR-074K7L; RoHS: Yes; Category: Chip SMD Resistors; Stock 1: 2420000; Pricing 1: 10000=0.00085 (USD); Case/Package: 0402; Number of Pins: 2; Case Code (Imperial): 0402; Case Code (Metric): 1005; Size Code: 0402; Min Operating Temperature: -55°C; Max Operating Temperature: 155°C; Tolerance: 1%; Voltage Rating: 50V; Packaging: Tape and Reel; Resistor Type: Thick Film; Termination: SMD/SMT; Features: Moisture Resistant; Series: RC; Number of Terminations: 2; Resistance Tolerance: 1%; Construction: Rectangular; Length: 1mm; Width: 0.5mm; Height: 0.32mm; Depth: 0.5mm; Height - Seated (Max): 0.016inch; RoHS Compliant: Yes; Reach SVHC Compliant: Yes; Military Standard: Not; Lead Free: Lead Free; ComponentLink1URL: https://datasheet.ciiva.com/22661/1686128-22661342.pdf?src-supplier=Element14; ComponentLink1Description: https://datasheet.ciiva.com/22661/1686128-22661342.pdf?src-supplier=Element14; ComponentLink2URL: https://datasheet.ciiva.com/7850/1018594-7850022.pdf?src-supplier=Element14; ComponentLink2Description: https://datasheet.ciiva.com/7850/1018594-7850022.pdf?src-supplier=Element14; ComponentLink3URL: https://datasheet.ciiva.com/7850/1018594-7850023.pdf?src-supplier=Element14; ComponentLink3Description: https://datasheet.ciiva.com/7850/1018594-7850023.pdf?src-supplier=Element14; ComponentLink4URL: https://datasheet.ciiva.com/15215/getdatasheetpartid-328119-15215035.pdf?src-supplier=Verical; ComponentLink4Description: https://datasheet.ciiva.com/15215/getdatasheetpartid-328119-15215035.pdf?src-supplier=Verical; Supplier Part Number 1: RC0402FR-074K7L; LCSC Part Number: C105871
R15 R20 R26 = RT0402BRE0727KL: RES SMD 27K OHM 0.1% 1/16W 0402; Manufacturer: Yageo; Value: 27kR; Max Power Dissipation: 63mW; Temperature Coefficient: 50ppm/°C; Voltage Rating (DC): 50V; Item Type: Resistor; Supplier: Digikey; Supplier Part Number: YAG4364CT-ND; Manufacturer Part Number: RT0402BRE0727KL; RoHS: Yes; Category: Chip SMD Resistors; Stock: 20118; Pricing: 1=0.16, 10=0.121, 50=0.0958, 100=0.0858, 500=0.06536, 1000=0.05776, 5000=0.0428 (USD); Case/Package: 0402; Case Code (Imperial): 0402; Min Operating Temperature: -55°C; Max Operating Temperature: 155°C; Package Quantity: 10000; Packaging: Tape and Reel; Tolerance: 0.1%; Number of Terminations: 2; Series: RT; Length: 0.039inch; Width: 0.02inch; Height: 0.014inch; Lead Free: Lead Free; RoHS Compliant: Yes; ComponentLink1URL: https://datasheet.ciiva.com/2582/pyu-rt-1-to-0-05-rohs-l-5-2582721.pdf?src-supplier=Digikey; ComponentLink1Description: https://datasheet.ciiva.com/2582/pyu-rt-1-to-0-05-rohs-l-5-2582721.pdf?src-supplier=Digikey; LCSC Part Number: C853174
R28 = RC0402FR-07100KL: RES 100K OHM 1% 1/16W 0402; Manufacturer: Yageo; Resistance: 100kR; Temperature Coefficient: 100ppm/°C; Power Rating: 63mW; Voltage Rating: 50V; Item Type: Resistor; Supplier 1: Mouser; Manufacturer Part Number: RC0402FR-07100KL; RoHS: Yes; Category: Chip SMD Resistors; Stock 1: 7759549; Pricing 1: 1=0.10000, 10=0.01200, 50=0.01200, 100=0.00500, 1000=0.00300, 2500=0.00200, 10000=0.00100 (USD); Case/Package: 0402; Case Code (Metric): 1005; Case Code (Imperial): 0402; Min Operating Temperature: -55°C; Max Operating Temperature: 155°C; Resistor Type: Thick Film; Tolerance: 1%; Packaging: Tape and Reel; Package Quantity: 1; Number of Terminations: 2; Termination: SMD/SMT; Max Power Dissipation: 63mW; Working Voltage: 50V; Features: Moisture Resistant; Series: RC; Resistance Tolerance: 1%; Construction: Rectangular; Technology: THICK FILM; Length: 0.039inch; Width: 0.02inch; Height: 0.016inch; Depth: 0.5mm; REACH SVHC: No SVHC; Lead Free: Lead Free; RoHS Compliant: Yes; Military Standard: Not; ComponentLink1URL: https://datasheet.ciiva.com/11819/0900766b80c66297-11819452.pdf?src-supplier=RSComponents; ComponentLink1Description: https://datasheet.ciiva.com/11819/0900766b80c66297-11819452.pdf?src-supplier=RSComponents; ComponentLink2URL: https://datasheet.ciiva.com/22747/1018594-22747509.pdf?src-supplier=Element14; ComponentLink2Description: https://datasheet.ciiva.com/22747/1018594-22747509.pdf?src-supplier=Element14; ComponentLink3URL: https://datasheet.ciiva.com/2453/pyu-r-int-thick-7-2453362.pdf?src-supplier=Digi-Key; ComponentLink3Description: https://datasheet.ciiva.com/2453/pyu-r-int-thick-7-2453362.pdf?src-supplier=Digi-Key; ComponentLink4URL: https://datasheet.ciiva.com/2453/pyu-r-int-thick-7-2453363.pdf?src-supplier=Digi-Key; ComponentLink4Description: https://datasheet.ciiva.com/2453/pyu-r-int-thick-7-2453363.pdf?src-supplier=Digi-Key; ComponentLink5URL: https://datasheet.ciiva.com/2453/pyu-r-int-thick-7-2453361.pdf?src-supplier=Digi-Key; ComponentLink5Description: https://datasheet.ciiva.com/2453/pyu-r-int-thick-7-2453361.pdf?src-supplier=Digi-Key; ComponentLink6URL: https://datasheet.ciiva.com/12667/pyu-rc0402-51-rohs-l-6-r-12667930.pdf?src-supplier=Mouser; ComponentLink6Description: https://datasheet.ciiva.com/12667/pyu-rc0402-51-rohs-l-6-r-12667930.pdf?src-supplier=Mouser; ComponentLink7URL: https://datasheet.ciiva.com/15189/getdatasheetpartid-323696-15189334.pdf?src-supplier=Verical; ComponentLink7Description: https://datasheet.ciiva.com/15189/getdatasheetpartid-323696-15189334.pdf?src-supplier=Verical; Supplier Part Number 1: 603-RC0402FR-07100KL; LCSC Part Number: C60491
R30 = RC0402FR-0733KL: RES 33K OHM 1% 1/16W 0402; Manufacturer: YAGEO; Item Type: Resistor; Manufacturer Part Number: RC0402FR-0733KL; Package: 0402; LCSC Part Number: C138003; ComponentLink1Description: LCSC; ComponentLink1URL: https://www.lcsc.com/product-detail/Chip-Resistor-Surface-Mount_YAGEO-RC0402FR-0733KL_C138003.html
R31 R34 = AC0402FR-070RL: RESISTOR 0402 JUMPER ZERO OHM; Manufacturer: Yageo; Voltage Rating: 50V; Power Rating: 62.5mW; Tolerance: 1%; Temperature Coefficient: 200ppm/°C; Supplier: Digi-Key; Supplier Part Number: 13-AC0402FR-070RLDKR-ND; Manufacturer Part Number: AC0402FR-070RL; RoHS: Yes; Category: Chip SMD Resistors; Stock: 337140; Pricing: 1=0.1, 10=0.017, 25=0.0132, 50=0.01, 100=0.0071, 250=0.00568, 500=0.00454, 1000=0.00335, 5000=0.0024 (USD); Case/Package: 0402; Case Code (Imperial): 0402; Case Code (Metric): 1005; Min Operating Temperature: -55°C; Max Operating Temperature: 155°C; Value: 0R; Packaging: Tape and Reel; Termination: SMD/SMT; Series: AC; Height: 370um; ComponentLink1URL: https://datasheet.ciiva.com/12656/pyu-ac-51-rohs-l-2-12656734.pdf?src-supplier=Mouser; ComponentLink1Description: https://datasheet.ciiva.com/12656/pyu-ac-51-rohs-l-2-12656734.pdf?src-supplier=Mouser; LCSC Part Number: C226739; Item Type: Resistor; ComponentLink2Description: LCSC; ComponentLink2URL: https://www.lcsc.com/product-detail/Chip-Resistor-Surface-Mount_YAGEO-AC0402FR-070RL_C226739.html
RT1 = 3296W-1-105: ±10% 1MΩ Plugin Variable Resistors/Potentiometers ROHS; Manufacturer: BOCHEN; Manufacturer Part Number: 3296W-1-105; Package: Plugin; LCSC Part Number: C118944; Item Type: Potentiometers; ComponentLink1Description: LCSC; ComponentLink1URL: https://www.lcsc.com/product-detail/Variable-Resistors-Potentiometers_BOCHEN-Chengdu-Guosheng-Tech-3296W-1-105_C118944.html
SW1 = TSC016A03526A: 4.5mm 3.5mm 50mA Round Button Straight 4.5mm 260gf 12V Plugin Tactile Switches ROHS; Manufacturer: BZCN; Manufacturer Part Number: TSC016A03526A; Package: Plugin; LCSC Part Number: C2888490; Item Type: Tactile Switch; ComponentLink1Description: LCSC; ComponentLink1URL: https://jlcpcb.com/partdetail/Bzcn-TSC016A03526A/C2888490
U1 = HEF4069UBT,653: IC INVERTER 6CH 1-INP 14SO; Manufacturer: Nexperia; Supplier: Future Electronics; Supplier Part Number: 4111431; Manufacturer Part Number: HEF4069UBT,653; RoHS: Yes; Item Type: IC; Stock: 2500; Pricing: 2500=0.109, 7500=0.106, 10000=0.105, 25000=0.103, 37500=0.1 (USD); RoHS Compliant: Yes; ComponentLink1URL: https://datasheet.octopart.com/HEF4069UBT%2C653-Nexperia-datasheet-11793750.pdf?src-supplier=Farnell; ComponentLink1Description: https://datasheet.octopart.com/HEF4069UBT%2C653-Nexperia-datasheet-11793750.pdf?src-supplier=Farnell; ComponentLink2URL: https://datasheet.octopart.com/HEF4069UBT%2C653-Nexperia-datasheet-62331911.pdf?src-supplier=Element14; ComponentLink2Description: https://datasheet.octopart.com/HEF4069UBT%2C653-Nexperia-datasheet-62331911.pdf?src-supplier=Element14; ComponentLink3URL: https://assets.nexperia.com/documents/data-sheet/HEF4069UB.pdf?src-supplier=Digikey; ComponentLink3Description: https://assets.nexperia.com/documents/data-sheet/HEF4069UB.pdf?src-supplier=Digikey; ComponentLink4URL: https://datasheet.octopart.com/HEF4069UBT%2C653-NXP-Semiconductors-datasheet-8884867.pdf?src-supplier=Newark; ComponentLink4Description: https://datasheet.octopart.com/HEF4069UBT%2C653-NXP-Semiconductors-datasheet-8884867.pdf?src-supplier=Newark; ComponentLink5URL: https://datasheet.octopart.com/HEF4069UBT%2C653-Nexperia-datasheet-10127420.pdf?src-supplier=Future+Electronics; ComponentLink5Description: https://datasheet.octopart.com/HEF4069UBT%2C653-Nexperia-datasheet-10127420.pdf?src-supplier=Future+Electronics; LCSC Part Number: C6739
U2 U3 = PC817C: 70V 5kV 50mA 100mV@1mA,20mA 1 6V 1.2V DC SMD-4 Transistor Output Optocoupler ROHS; Manufacturer: Slkor; Item Type: IC; Manufacturer Part Number: PC817C; Package: SMD-4; LCSC Part Number: C2936043; ComponentLink1Description: LCSC; ComponentLink1URL: https://www.lcsc.com/product-detail/Transistor-Output-Optocoupler_Slkor-SLKORMICRO-Elec-PC817C_C2936043.html
U4 = NE555DTR(XBLW): NO SOP-8 Timers ROHS; Item Type: IC; Manufacturer: XBLW; Manufacturer Part Number: NE555DTR(XBLW); Package: SOP-8; LCSC Part Number: C18723595; ComponentLink1Description: LCSC; ComponentLink1URL: https://www.lcsc.com/product-detail/Timers_span-style-background-color-ff0-XBLW-span-NE555DTR-XBLW_C18723595.html
U5 = SPX3819M5-L-1-8/TR: LDO Voltage Regulators 500mA LOW NOISE LDO; Manufacturer: MaxLinear; Item Type: IC; Supplier 1: Mouser; Manufacturer Part Number: SPX3819M5-L-1-8/TR; RoHS: Yes; Stock 1: 19446; Pricing 1: 1=0.68000, 10=0.57700, 50=0.57700, 100=0.40000, 1000=0.26200, 10000=0.21000 (USD); RoHS Compliant: Yes; ComponentLink1URL: https://www.exar.com/content/document.ashx?id=22106&src-supplier=Digi-Key; ComponentLink1Description: https://www.exar.com/content/document.ashx?id=22106&src-supplier=Digi-Key; Supplier Part Number 1: 701-SPX3819M5-L-18TR